# EasyEDA Pro project ProProject_大疆无人机PSDK开发板_2026-03-01.epro, schematic PSDK_STM32
Board Name: Board1; Create Date: 2025-10-24; Page Name: Main; Project Name: 大疆无人机PSDK开发板; Schematic Name: PSDK_STM32; Update Date: 2025-10-24; Company: 嘉立创EDA; Page Size: A2; Version: V1.0
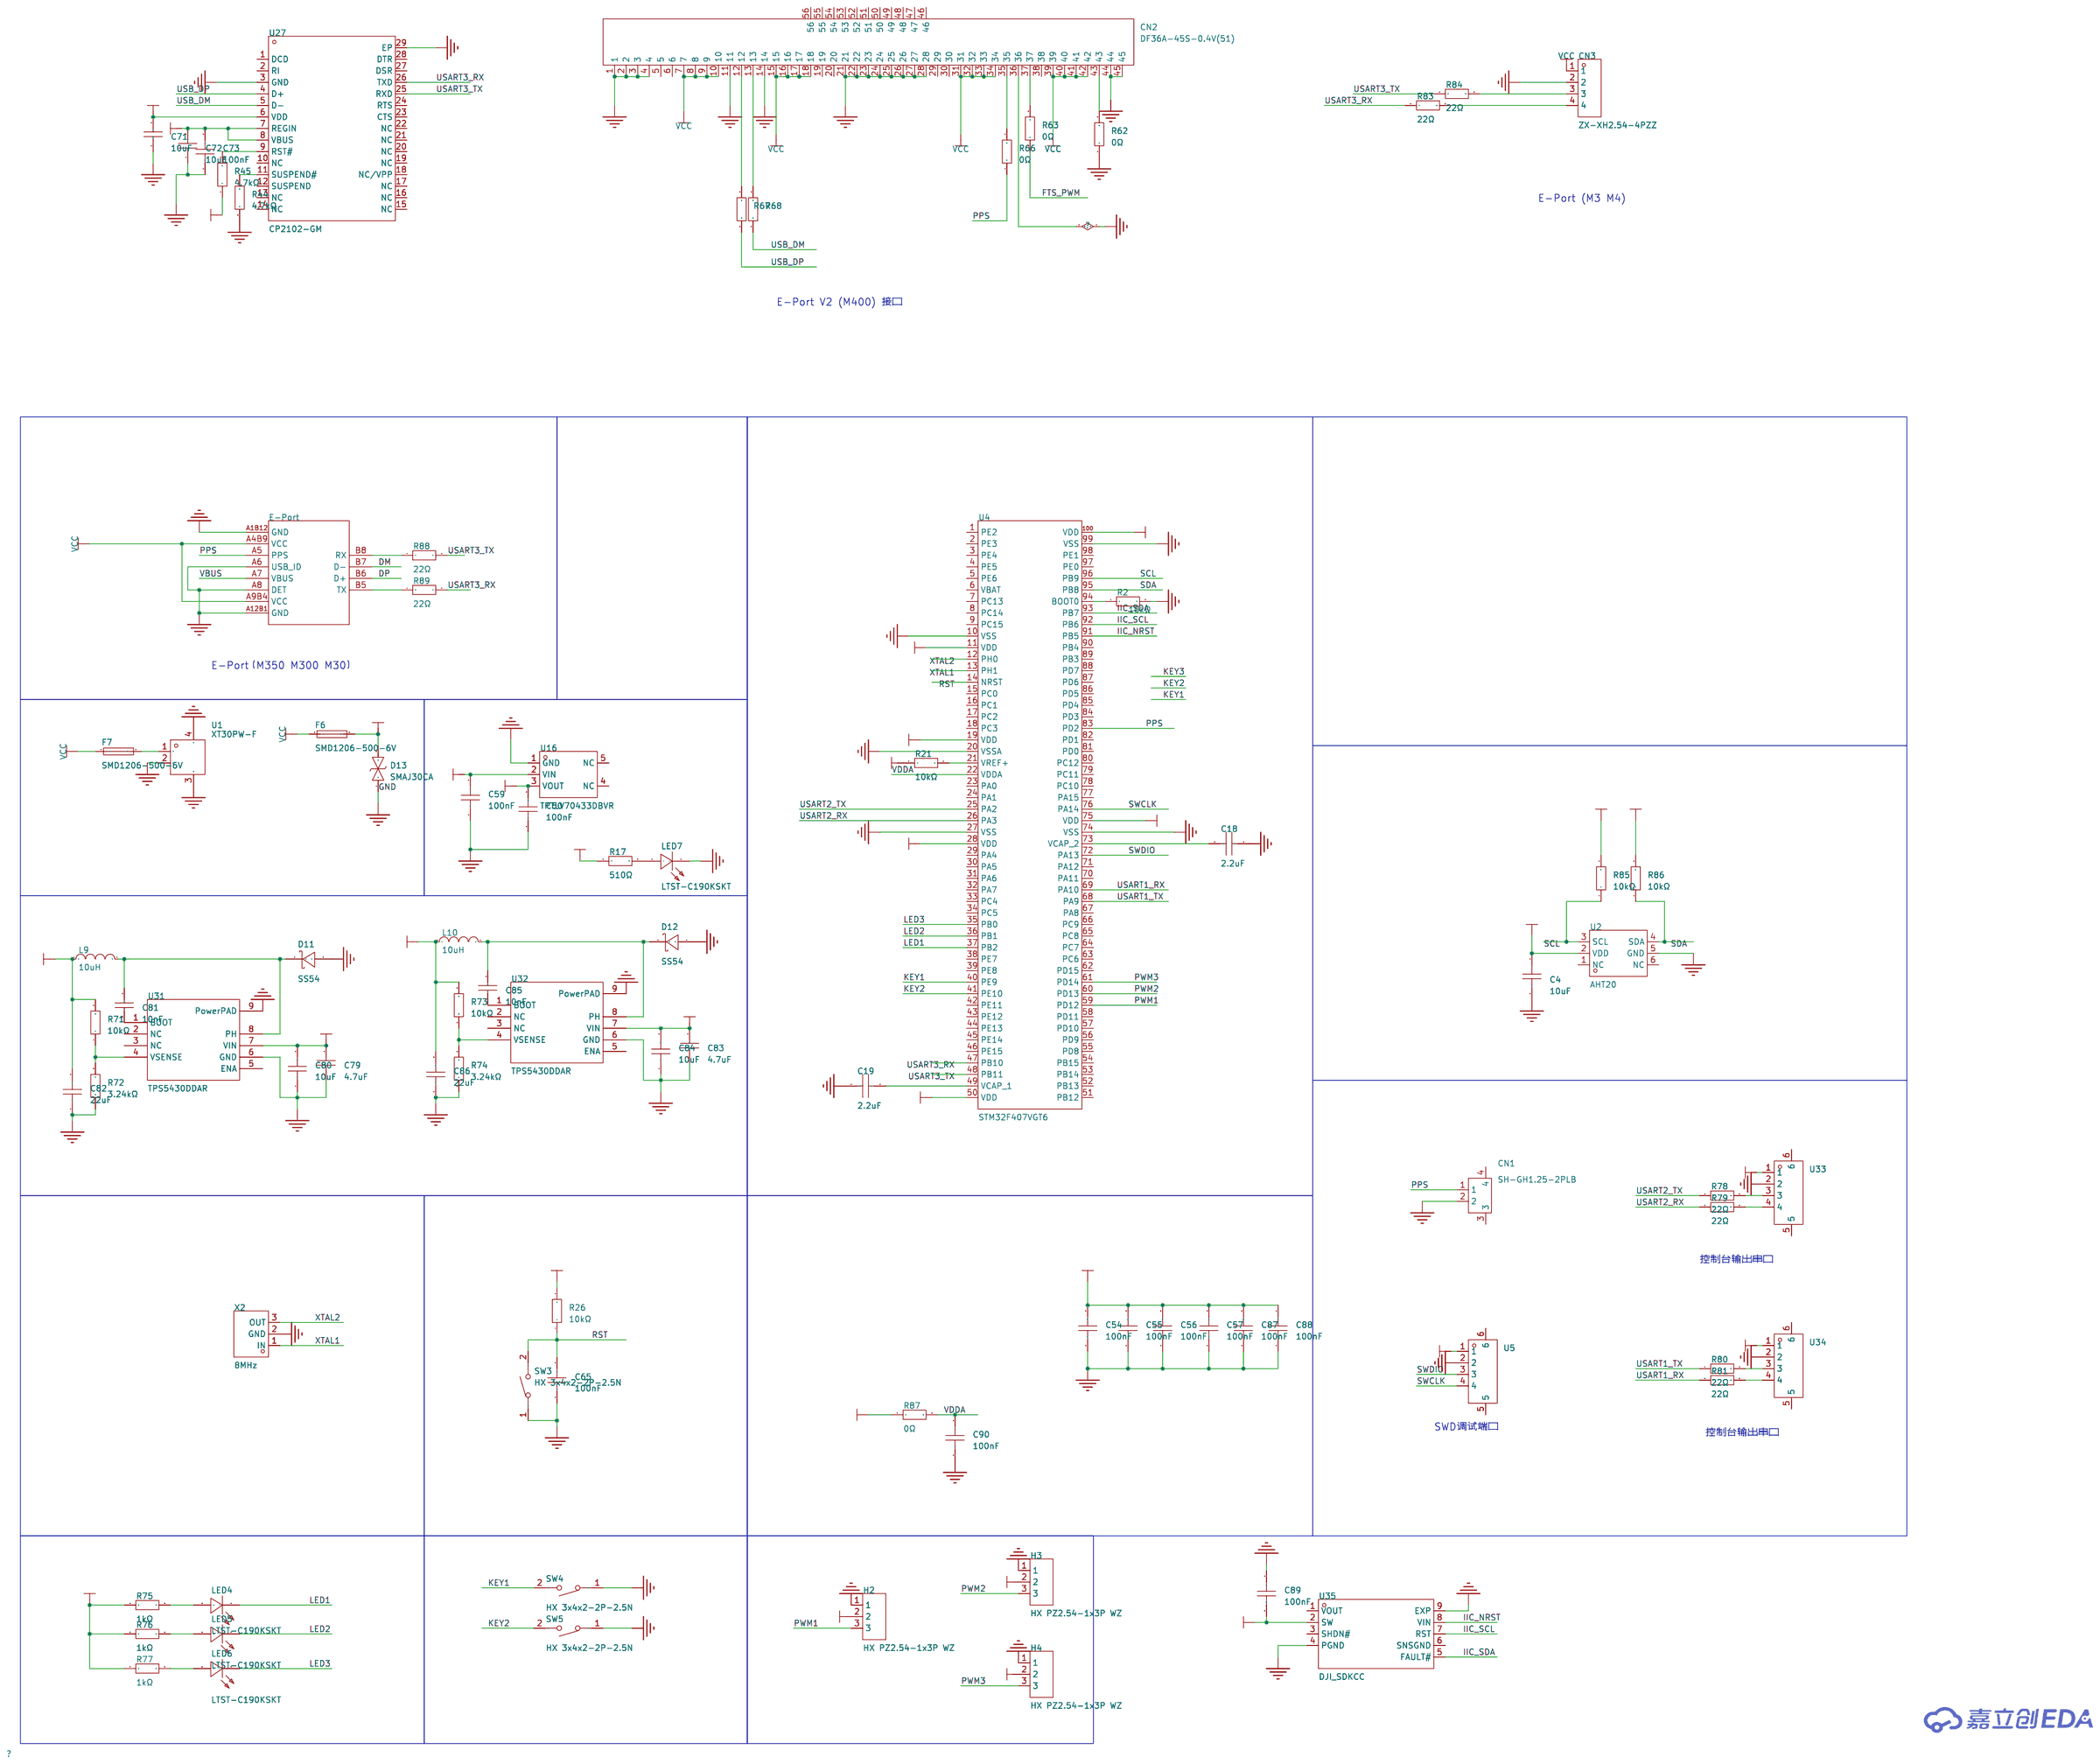
[diagram p0: schematic sheet]

## Parts
C4  10uF  [C0603]
C18  2.2uF  [C0402]
C19  2.2uF  [C0402]
C54  100nF  [C0402]
C55  100nF  [C0402]
C56  100nF  [C0402]
C57  100nF  [C0402]
C59  100nF  [C0603]
C60  100nF  [C0603]
C65  100nF  [C0402]
C71  10uF  [C0402]
C72  10uF  [C0402]
C73  100nF  [C0402]
C79  4.7uF  [C0805]
C80  10uF  [C0805]
C81  10nF  [C0603]
C82  22uF  [C0805]
C83  4.7uF  [C0805]
C84  10uF  [C0805]
C85  10nF  [C0603]
C86  22uF  [C0805]
C87  100nF  [C0402]
C88  100nF  [C0402]
C89  100nF  [C0402]
C90  100nF  [C0402]
CN1  SH-GH1.25-2PLB  [CONN-SMD_2P-P1.25_SHOUHAN_1.25-2PLTDK]
CN2  DF36A-45S-0.4V(51)  [CONN-SMD_45P-P0.40_DF36A-45S-0.4V]
CN3  ZX-XH2.54-4PZZ  [CONN-TH_4P-P2.50_4PIN]
D11  SS54  [SMA_L4.4-W2.8-LS5.4-R-RD]
D12  SS54  [SMA_L4.4-W2.8-LS5.4-R-RD]
D13  SMAJ30CA  [SMA_L4.4-W2.8-LS5.1-BI]
E-Port  -  [PSDK-SMD]
F6  SMD1206-500-6V  [F1206]
F7  SMD1206-500-6V  [F1206]
H2  HX PZ2.54-1x3P WZ  [HDR-TH_3P-P2.54-H-M-W10.4-N]
H3  HX PZ2.54-1x3P WZ  [HDR-TH_3P-P2.54-H-M-W10.4-N]
H4  HX PZ2.54-1x3P WZ  [HDR-TH_3P-P2.54-H-M-W10.4-N]
L9  10uH  [IND-SMD_L5.4-W5.2_FXL0530]
L10  10uH  [IND-SMD_L5.4-W5.2_FXL0530]
LED4  LTST-C190KSKT  [LED0603-RD]
LED5  LTST-C190KSKT  [LED0603-RD]
LED6  LTST-C190KSKT  [LED0603-RD]
LED7  LTST-C190KSKT  [LED0603-RD]
R2  10kΩ  [R0603]
R17  510Ω  [R0603]
R21  10kΩ  [R0402]
R26  10kΩ  [R0402]
R44  4.7kΩ  [R0402]
R45  4.7kΩ  [R0402]
R62  0Ω  [R0402]
R63  0Ω  [R0402]
R66  0Ω  [R0402]
R67  22Ω  [R0402]
R68  22Ω  [R0402]
R71  10kΩ  [R0603]
R72  3.24kΩ  [R0603]
R73  10kΩ  [R0603]
R74  3.24kΩ  [R0603]
R75  1kΩ  [R0603]
R76  1kΩ  [R0603]
R77  1kΩ  [R0603]
R78  22Ω  [R0402]
R79  22Ω  [R0402]
R80  22Ω  [R0402]
R81  22Ω  [R0402]
R83  22Ω  [R0603]
R84  22Ω  [R0603]
R85  10kΩ  [R0402]
R86  10kΩ  [R0402]
R87  0Ω  [R0402]
R88  22Ω  [R0402]
R89  22Ω  [R0402]
SW3  HX 3x4x2-2P-2.5N  [SW-SMD_L4.0-W2.9-LS5.0]
SW4  HX 3x4x2-2P-2.5N  [SW-SMD_L4.0-W2.9-LS5.0]
SW5  HX 3x4x2-2P-2.5N  [SW-SMD_L4.0-W2.9-LS5.0]
U1  XT30PW-F  [CONN-TH_XT30PW-F]
U2  AHT20  [SENSOR-SMD_L3.0-W3.0-P1.00-BR]
U4  STM32F407VGT6  [LQFP-100_L14.0-W14.0-P0.50-LS16.0-BL]
U5  WAFER-GH1.25-4PLB  [CONN-SMD_4P-P1.25_XUNPU_WAFER-GH1.25-4PLB]
U16  TPTLV70433DBVR  [SOT-23-5_L3.0-W1.6-P0.95-LS2.8-BR]
U27  CP2102-GM  [QFN-28_L5.0-W5.0-P0.50-TL-EP3.2]
U31  TPS5430DDAR  [ESOP-8_L4.9-W3.9-P1.27-LS6.0-TL-EP]
U32  TPS5430DDAR  [ESOP-8_L4.9-W3.9-P1.27-LS6.0-TL-EP]
U33  WAFER-GH1.25-4PLB  [CONN-SMD_4P-P1.25_XUNPU_WAFER-GH1.25-4PLB]
U34  WAFER-GH1.25-4PLB  [CONN-SMD_4P-P1.25_XUNPU_WAFER-GH1.25-4PLB]
U35  DJI_SDKCC  [DFN-8_L3.0-W2.0-P0.50-BL-EP]
X2  8MHz  [OSC-SMD_3P-L3.2-W1.3-P1.20]

## Library data of the parts
C4 = CL10A106MA8NRNC: 容值:10uF;精度:±20%;额定电压:25V;材质(温度系数):X5R;; LCSC Part Name: 10uF ±20% 25V; Supplier Part: C96446; Manufacturer: SAMSUNG(三星); Supplier Footprint: 0603; JLCPCB Part Class: 基础库; Datasheet: https://atta.szlcsc.com/upload/public/pdf/source/20170325/1490427913016.pdf; Supplier: LCSC; Tolerance: ±20%; Voltage Rated: 25V; Temperature Coefficient: X5R
C18 C19 = CL05A225MQ5NSNC: 容值:2.2uF;精度:±20%;额定电压:6.3V;温度系数:X5R;; LCSC Part Name: 2.2uF ±20% 6.3V; Supplier Part: C12530; Manufacturer: SAMSUNG(三星); Supplier Footprint: 0402; JLCPCB Part Class: 基础库; Datasheet: https://item.szlcsc.com/datasheet/CL05A225MQ5NSNC/13164.html; Supplier: LCSC; Tolerance: ±20%; Voltage Rating: 6.3V; Temperature Coefficient: X5R
C54-C57 C87 C88 = GRM155R71H104KE14D: 容值:100nF;精度:±10%;额定电压:50V;材质(温度系数):X7R;; LCSC Part Name: 100nF ±10% 50V; Supplier Part: C77020; Manufacturer: muRata(村田); Supplier Footprint: 0402; JLCPCB Part Class: Extended Part; Datasheet: https://atta.szlcsc.com/upload/public/pdf/source/20180326/C77020_39BD49C951FF1AF0DB1F1FAC5AC1E401.pdf; Supplier: LCSC; Tolerance: ±10%; Voltage Rated: 50V; Temperature Coefficient: X7R
C59 C60 = CC0603KRX7R9BB104: 容值:100nF;精度:±10%;额定电压:50V;材质(温度系数):X7R;; LCSC Part Name: 100nF ±10% 50V; Supplier Part: C14663; Manufacturer: YAGEO(国巨); Supplier Footprint: 0603; JLCPCB Part Class: 基础库; Datasheet: https://atta.szlcsc.com/upload/public/pdf/source/20180910/C282072_33301C7F631E79921B82A8DAC6BCC5B3.pdf; Supplier: LCSC; Tolerance: ±10%; Voltage Rated: 50V; Temperature Coefficient: X7R
C65 C73 C89 C90 = CL05B104KB54PNC: 容值:100nF;精度:±10%;额定电压:50V;材质(温度系数):X7R;; LCSC Part Name: 100nF ±10% 50V; Supplier Part: C307331; Manufacturer: SAMSUNG(三星); Supplier Footprint: 0402; JLCPCB Part Class: Basic Part; Datasheet: https://atta.szlcsc.com/upload/public/pdf/source/20160218/1457707763339.pdf; Supplier: LCSC; Tolerance: ±10%; Voltage Rated: 50V; Temperature Coefficient: X7R
C71 C72 = CL05A106MQ5NUNC: 容值:10uF;精度:±20%;额定电压:6.3V;材质(温度系数):X5R;; LCSC Part Name: 10uF ±20% 6.3V; Supplier Part: C15525; Manufacturer: SAMSUNG(三星); Supplier Footprint: 0402; JLCPCB Part Class: Basic Part; Datasheet: https://atta.szlcsc.com/upload/public/pdf/source/20220823/2B02EE04F8F211D38A52DCB16EB6BEBA.pdf; Supplier: LCSC; Tolerance: ±20%; Voltage Rated: 6.3V; Temperature Coefficient: X5R
C79 C83 = CL21A475KAQNNNE: 容值:4.7uF;精度:±10%;额定电压:25V;材质(温度系数):X5R;; LCSC Part Name: 4.7uF ±10% 25V; Supplier Part: C1779; Manufacturer: SAMSUNG(三星); Supplier Footprint: 0805; JLCPCB Part Class: Basic Part; Datasheet: https://atta.szlcsc.com/upload/public/pdf/source/20160218/1457707763339.pdf; Supplier: LCSC; Tolerance: ±10%; Voltage Rated: 25V; Temperature Coefficient: X5R
C80 C84 = CL21A106KAYNNNE_C15850: 容值:10uF;精度:±10%;额定电压:25V;材质(温度系数):X5R;; LCSC Part Name: 10uF ±10% 25V; Supplier Part: C15850; Manufacturer: SAMSUNG(三星); Manufacturer Part: CL21A106KAYNNNE; Supplier Footprint: 0805; JLCPCB Part Class: Basic Part; Datasheet: https://atta.szlcsc.com/upload/public/pdf/source/20160218/1457707763339.pdf; Supplier: LCSC; Tolerance: ±10%; Voltage Rated: 25V; Temperature Coefficient: X5R
C81 C85 = 0603B103K500NT: 容值:10nF;精度:±10%;额定电压:50V;材质(温度系数):X7R;; LCSC Part Name: 10nF ±10% 50V; Supplier Part: C57112; Manufacturer: FH(风华); Supplier Footprint: 0603; JLCPCB Part Class: 基础库; Datasheet: https://atta.szlcsc.com/upload/public/pdf/source/20200305/C486355_26A10D38EF8C2A5C37091D0039909270.pdf; Supplier: LCSC; Tolerance: ±10%; Voltage Rated: 50V; Temperature Coefficient: X7R
C82 C86 = CL21A226MAQNNNE: 容值:22uF;精度:±20%;额定电压:25V;材质(温度系数):X5R;; LCSC Part Name: 22uF ±20% 25V; Supplier Part: C45783; Manufacturer: SAMSUNG(三星); Supplier Footprint: 0805; JLCPCB Part Class: 基础库; Datasheet: https://atta.szlcsc.com/upload/public/pdf/source/20160218/1457707763339.pdf; Supplier: LCSC; Tolerance: ±20%; Voltage Rated: 25V; Temperature Coefficient: X5R
CN1 = SH-GH1.25-2PLB: 插针结构:1x2P;间距:1.25mm;安装方式:立贴;参考系列:GH;总PIN数:2P;排数:1;每排PIN数:2;额定电流:1A;触头材质:磷青铜;触头镀层:锡;工作温度:-25℃~+85℃;; LCSC Part Name: 1x2P 间距:1.25mm 立贴 系列:GH; Supplier Part: C42376899; Manufacturer: SHOU HAN(首韩); Supplier Footprint: SMD,P=1.25mm; Datasheet: https://item.szlcsc.com/datasheet/SH-GH1.25-2PLB/44272939.html; Supplier: LCSC; Pins Structure: 1x2P; Pitch: 1.25mm; Mounting Type: 立贴; Reference Series: GH; Number of Pins: 2P; Number of Rows: 1; Number of PINs Per Row: 2; Current Rating: 1A; Contact Material: 磷青铜; Contact Plating: 锡; Operating Temperature: -25℃~+85℃; Voltage Rating: 125V; Plastic Material: LCP; Flame Retardant Rating: UL94V-0; Color: 米色
CN2 = DF36A-45S-0.4V(51)_C22001977: Supplier Part: C22001977; Manufacturer: HRS(广濑); Supplier Footprint: SMD,P=0.4mm,卧贴; JLCPCB Part Class: 扩展库; Datasheet: https://atta.szlcsc.com/upload/public/pdf/source/20240705/4BAFE627F25BAFC4B98167FD612B90FB.pdf; Supplier: LCSC
CN3 = ZX-XH2.54-4PZZ: 插针结构:1x4P;间距:2.5mm;安装方式:直插;参考系列:XH;总PIN数:4P;排数:1;每排PIN数:4;行距:-;额定电流:3A;触头材质:黄铜;触头镀层:锡;工作温度:-25℃~+85℃;; LCSC Part Name: 1x4P 间距:2.5mm 直插 系列:XH; Supplier Part: C7429634; Manufacturer: Megastar(兆星); Supplier Footprint: 插件,P=2.5mm; JLCPCB Part Class: 扩展库; Datasheet: https://item.szlcsc.com/datasheet/ZX-XH2.54-4PZZ/8427551.html; Supplier: LCSC; Pins Structure: 1x4P; Pitch: 2.5mm; Mounting Type: 直插; Reference Series: XH; Number of Pins: 4P; Number of Rows: 1; Number of PINs Per Row: 4; Current Rating: 3A; Contact Material: 黄铜; Contact Plating: 锡; Operating Temperature: -25℃~+85℃; Voltage Rating: 250V; Plastic Material: PA66; Flame Retardant Rating: UL94V-0; Color: 白色; Z-Height of the Board: 7mm; X-Length of Bottom Edge on Board (Spacing Line): 12.5mm; Y-Width of Bottom Edge on Board: 5.9mm
D11 D12 = SS54_C22452: 直流反向耐压（Vr）:40V;平均整流电流（Io）:5A;正向压降（Vf）:550mV @ 5A;; Supplier Part: C22452; Manufacturer: MDD; Supplier Footprint: SMA(DO-214AC); JLCPCB Part Class: 基础库; Datasheet: https://atta.szlcsc.com/upload/public/pdf/source/20230314/529CD85F9B31F69841D3A079BC07E377.pdf; Supplier: LCSC; Forward Voltage (Vf@If): 550mV@5A; Reverse Voltage (Vr): 40V; Average Rectified Current (Io): 5A; Reverse Leakage Current (Ir): 1mA@40V
D13 = SMAJ30CA_C908828: 反向截止电压(Vrwm):30V;最大钳位电压:48.4V;峰值脉冲电流(Ipp)@10/1000us:8.3A;击穿电压:33.3V;; LCSC Part Name: 双向TVS 30V截止 8.3A峰值脉冲; Supplier Part: C908828; Manufacturer: GOODWORK(固得沃克); Supplier Footprint: SMA(DO-214AC); JLCPCB Part Class: Extended Part; Datasheet: https://atta.szlcsc.com/upload/public/pdf/source/20201231/C908757_5436EAF671B686EFC2F0DD2098F0ED89.pdf; Supplier: LCSC; Reverse Stand-Off Voltage (Vrwm): 30V; Maximum Clamping Voltage: 48.4V; Peak Pulse Current (Ipp)@10/1000us: 8.3A; Breakdown Voltage: 33.3V; Reverse Leakage Current (Ir): 5uA; Type: TVS
E-Port = E-Port: E-Port接口
F6 F7 = SMD1206-500-6V: 最大电压:6V;最大电流:50A;保持电流:5A;跳闸电流:10A;; LCSC Part Name: 6V 5A 1206自恢复; Supplier Part: C2760308; Manufacturer: BNstar(比诺星); Supplier Footprint: 1206; JLCPCB Part Class: Extended Part; Datasheet: https://atta.szlcsc.com/upload/public/pdf/source/20210406/C2760308_0B2BB5269508B162565B8482311CFD3E.pdf; Supplier: LCSC; Operating Voltage (Max): 6V; Current Rating (Max): 50A; Hold Current: 5A; Trip Current: 10A; Power Dissipation: 1.5W; Resistance - Initial (Ri) (Min): 1mΩ; Resistance - Post Trip (R1) (Max): 12mΩ; Maximum Time to Trip: 5s; Operating Temperature: -40℃~+70℃
H2-H4 = HX PZ2.54-1x3P WZ: 插针结构:1x3P;间距:2.54mm;行距:-;圆针/方针:方针;安装方式:弯插;排数:单排;总PIN位数:3P;额定电流:3A;额定电压:1kV;配合针长度:6mm;塑高:2.5mm;端接针长度:-;触头材质:黄铜;触头镀层:金;工作温度:-40℃~+105℃;颜色:黑色;; LCSC Part Name: 1x3P 间距:2.54mm 方针 弯插; Supplier Part: C32713262; Manufacturer: hanxia(韩下); Supplier Footprint: 弯插,P=2.54mm; JLCPCB Part Class: 扩展库; Datasheet: https://item.szlcsc.com/datasheet/HX%2520PZ2.54-1x3P%2520WZ/34444542.html; Supplier: LCSC; Pin Structure: 1x3P; Pitch: 2.54mm; Circluar Pins/Square Pins: 方针; Mounting Type: 弯插; Number of Rows: 单排; Number of Pins: 3P; Current Rating: 3A; Voltage Rating (Max): 1kV; Length of Mating Pin: 6mm; Insulation Height: 2.5mm; Contact Material: 黄铜; Contact Plating: 金; Operating Temperature: -40℃~+105℃; Color: 黑色
L9 L10 = FXL0530-100-M: 电感值:10uH;精度:±20%;额定电流:3.2A;饱和电流(Isat):3.5A;类型:一体成型电感;; LCSC Part Name: 10uH ±20% 3.5A; Supplier Part: C177248; Manufacturer: cjiang(长江微电); Supplier Footprint: SMD,5.2x5.4mm; JLCPCB Part Class: 扩展库; Datasheet: https://atta.szlcsc.com/upload/public/pdf/source/20240426/3189EA8206330E2108542F9E34E540E7.pdf; Supplier: LCSC; Tolerance: ±20%; Rated Current: 3.2A; Saturation Current (Isat): 3.5A; DC Resistance (DCR): 125mΩ; Type: 一体成型电感
LED4-LED7 = LTST-C190KSKT: 发光颜色:黄色;正向电压(VF):2.1V;功率:75mW;正向电流:20mA;主波长:584.5nm~597nm;二极管配置:-;透镜颜色:无色透明透镜;色温:-;发光强度:104mcd;发光角度:130°;载带方式:-;工作温度:-30℃~+85℃;; LCSC Part Name: 黄灯; Supplier Part: C125095; Manufacturer: LITEON(光宝); Supplier Footprint: 0603; JLCPCB Part Class: 扩展库; Datasheet: https://atta.szlcsc.com/upload/public/pdf/source/20180129/C125095_15171881843821315881.pdf; Supplier: LCSC; Emitted Color: 黄色; Forward Voltage (VF): 2.1V; Power Dissipation: 75mW; Forward Current: 20mA; Dominant Wavelength: 584.5nm~597nm; Peak Wavelength: 588nm; Lens Color: 无色透明透镜; Luminous Intensity: 104mcd; Viewing Angle: 130°; Operating Temperature: -30℃~+85℃
R2 R71 R73 = 0603WAF1002T5E: 电阻类型:厚膜电阻;阻值:10kΩ;精度:±1%;功率:100mW;; LCSC Part Name: 厚膜电阻 10kΩ ±1% 100mW; Supplier Part: C25804; Manufacturer: UNI-ROYAL(厚声); Supplier Footprint: 0603; JLCPCB Part Class: 基础库; Datasheet: https://atta.szlcsc.com/upload/public/pdf/source/20200306/C422600_1E6D84923E4A46A82E41ADD87F860B5C.pdf; Supplier: LCSC; Type: 厚膜电阻; Tolerance: ±1%; Power(Watts): 100mW; Temperature Coefficient: ±100ppm/℃; Overload Voltage (Max): 75V; Operating Temperature Range: -55℃~+155℃
R17 = 0603WAF5100T5E: 电阻类型:厚膜电阻;阻值:510Ω;精度:±1%;功率:100mW;; LCSC Part Name: 510Ω ±1% 100mW; Supplier Part: C23193; Manufacturer: UNI-ROYAL(厚声); Supplier Footprint: 0603; JLCPCB Part Class: 基础库; Datasheet: https://atta.szlcsc.com/upload/public/pdf/source/20200306/C422600_1E6D84923E4A46A82E41ADD87F860B5C.pdf; Supplier: LCSC; Type: 厚膜电阻; Tolerance: ±1%; Power(Watts): 100mW; Temperature Coefficient: ±100ppm/℃; Overload Voltage (Max): 75V; Operating Temperature Range: -55℃~+155℃
R21 R85 R86 = 0402WGF1002TCE: 电阻类型:厚膜电阻;阻值:10kΩ;精度:±1%;功率:62.5mW;工作电压:50V;温度系数:±100ppm/℃;; LCSC Part Name: 10kΩ ±1% 62.5mW 厚膜电阻; Supplier Part: C25744; Manufacturer: UNI-ROYAL(厚声); Supplier Footprint: 0402; JLCPCB Part Class: 基础库; Datasheet: https://item.szlcsc.com/datasheet/0402WGF1002TCE/26487.html; Supplier: LCSC; Type: 厚膜电阻; Tolerance: ±1%; Power(Watts): 62.5mW; Voltage-Supply(Max): 50V; Temperature Coefficient: ±100ppm/℃; Operating Temperature: -55℃~+155℃
R26 = 0402WGF1002TCE: 电阻类型:厚膜电阻;阻值:10kΩ;精度:±1%;功率:62.5mW;工作电压:50V;温度系数:±100ppm/℃;; LCSC Part Name: 10kΩ ±1% 62.5mW 厚膜电阻; Supplier Part: C25744; Manufacturer: UNI-ROYAL(厚声); Supplier Footprint: 0402; JLCPCB Part Class: 基础库; Datasheet: https://item.szlcsc.com/datasheet/0402WGF1002TCE/26487.html; Supplier: LCSC; Type: 厚膜电阻; Tolerance: ±1%; Power(Watts): 62.5mW; Voltage-Supply(Max): 50V; Temperature Coefficient: ±100ppm/℃; Operating Temperature: -55℃~+155℃; Overload Voltage (Max): 50V; Operating Temperature Range: -55℃~+155℃
R44 R45 = 0402WGF4701TCE: 电阻类型:厚膜电阻;阻值:4.7kΩ;精度:±1%;功率:62.5mW;最大工作电压:50V;温度系数:±100ppm/℃;; LCSC Part Name: 4.7kΩ ±1% 62.5mW 厚膜电阻; Supplier Part: C25900; Manufacturer: UNI-ROYAL(厚声); Supplier Footprint: 0402; JLCPCB Part Class: Basic Part; Datasheet: https://atta.szlcsc.com/upload/public/pdf/source/20200306/C422600_1E6D84923E4A46A82E41ADD87F860B5C.pdf; Supplier: LCSC; Type: 厚膜电阻; Tolerance: ±1%; Power(Watts): 62.5mW; Overload Voltage (Max): 50V; Temperature Coefficient: ±100ppm/℃; Operating Temperature Range: -55℃~+155℃
R62 R63 R66 R87 = 0402WGF0000TCE: 电阻类型:厚膜电阻;阻值:0Ω;精度:±1%;功率:62.5mW;最大工作电压:50V;温度系数:±800ppm/℃;; LCSC Part Name: 0Ω ±1% 62.5mW 厚膜电阻; Supplier Part: C17168; Manufacturer: UNI-ROYAL(厚声); Supplier Footprint: 0402; JLCPCB Part Class: Basic Part; Datasheet: https://atta.szlcsc.com/upload/public/pdf/source/20200306/C422600_1E6D84923E4A46A82E41ADD87F860B5C.pdf; Supplier: LCSC; Type: 厚膜电阻; Tolerance: ±1%; Power(Watts): 62.5mW; Overload Voltage (Max): 50V; Temperature Coefficient: ±800ppm/℃; Operating Temperature Range: -55℃~+155℃
R67 R68 R78-R81 R88 R89 = 0402WGF220JTCE: 电阻类型:厚膜电阻;阻值:22Ω;精度:±1%;功率:62.5mW;最大工作电压:50V;温度系数:±100ppm/℃;; LCSC Part Name: 22Ω ±1% 62.5mW 厚膜电阻; Supplier Part: C25092; Manufacturer: UNI-ROYAL(厚声); Supplier Footprint: 0402; JLCPCB Part Class: 基础库; Datasheet: https://atta.szlcsc.com/upload/public/pdf/source/20200306/C422600_1E6D84923E4A46A82E41ADD87F860B5C.pdf; Supplier: LCSC; Type: 厚膜电阻; Tolerance: ±1%; Power(Watts): 62.5mW; Overload Voltage (Max): 50V; Temperature Coefficient: ±100ppm/℃; Operating Temperature Range: -55℃~+155℃
R72 R74 = 0603WAF3241T5E: 电阻类型:厚膜电阻;阻值:3.24kΩ;精度:±1%;功率:100mW;最大工作电压:75V;温度系数:±100ppm/℃;; LCSC Part Name: 3.24kΩ ±1% 100mW 厚膜电阻; Supplier Part: C22994; Manufacturer: UNI-ROYAL(厚声); Supplier Footprint: 0603; JLCPCB Part Class: Extended Part; Datasheet: https://atta.szlcsc.com/upload/public/pdf/source/20200306/C422600_1E6D84923E4A46A82E41ADD87F860B5C.pdf; Supplier: LCSC; Type: 厚膜电阻; Tolerance: ±1%; Power(Watts): 100mW; Overload Voltage (Max): 75V; Temperature Coefficient: ±100ppm/℃; Operating Temperature Range: -55℃~+155℃
R75-R77 = 0603WAF1001T5E: 电阻类型:厚膜电阻;阻值:1kΩ;精度:±1%;功率:100mW;; LCSC Part Name: 1kΩ ±1% 100mW; Supplier Part: C21190; Manufacturer: UNI-ROYAL(厚声); Supplier Footprint: 0603; JLCPCB Part Class: 基础库; Datasheet: https://atta.szlcsc.com/upload/public/pdf/source/20200306/C422600_1E6D84923E4A46A82E41ADD87F860B5C.pdf; Supplier: LCSC; Type: 厚膜电阻; Tolerance: ±1%; Power(Watts): 100mW; Temperature Coefficient: ±100ppm/℃; Overload Voltage (Max): 75V; Operating Temperature Range: -55℃~+155℃
R83 R84 = 0603WAF220JT5E: 电阻类型:厚膜电阻;阻值:22Ω;精度:±1%;功率:100mW;; LCSC Part Name: 22Ω ±1% 100mW; Supplier Part: C23345; Manufacturer: UNI-ROYAL(厚声); Supplier Footprint: 0603; JLCPCB Part Class: 基础库; Datasheet: https://atta.szlcsc.com/upload/public/pdf/source/20200306/C422600_1E6D84923E4A46A82E41ADD87F860B5C.pdf; Supplier: LCSC; Type: 厚膜电阻; Tolerance: ±1%; Power(Watts): 100mW; Temperature Coefficient: ±100ppm/℃; Overload Voltage (Max): 75V; Operating Temperature Range: -55℃~+155℃
SW3-SW5 = HX 3x4x2-2P-2.5N: 电路结构:单刀单掷;按钮形状:圆形按钮;作用力:2.5N;安装方式:立贴;开关长度:4mm;开关宽度:3mm;开关高度:2mm;带支架:不带支架;触点电流:50mA;额定电压:12V;带灯:无;工作寿命:10万次;; LCSC Part Name: 4*3*2mm 立贴 轻触开关; Supplier Part: C36498961; Manufacturer: hanxia(韩下); Supplier Footprint: SMD,3x4mm; JLCPCB Part Class: 扩展库; Datasheet: https://item.szlcsc.com/datasheet/HX%25203x4x2-2P-2.5N/38220903.html; Supplier: LCSC; Circuit: 单刀单掷; Actuator Style: 圆形按钮; Operating Force: 2.5N; Mounting Type: 立贴; Length: 4mm; Width: 3mm; Switch Height: 2mm; with Bracket: 不带支架; Contact Current: 50mA; Voltage Rating: 12V; Actuator/Cap Color: 黑色; With Lamp: 无; Termination Style: SMD接片; Life: 10万次
U1 = XT30PW-F: Supplier Part: C2913282; Supplier Footprint: HDR-1X2; JLCPCB Part Class: 扩展库; Supplier: LCSC
U2 = AHT20: Supplier Part: C2757850; Manufacturer: 广州奥松; Supplier Footprint: SMD; JLCPCB Part Class: 扩展库; Datasheet: https://atta.szlcsc.com/upload/public/pdf/source/20200407/C503357_487829B2F97386053400E2E73B0ABB4D.pdf; Supplier: LCSC
U4 = STM32F407VGT6: CPU内核:ARM-M4;CPU最大主频:168MHz;应用领域:-;; LCSC Part Name: 带DSP和FPU的高性能基础系列ARM Cortex-M4 MCU，具有1 MB Flash、168 MHz CPU、ART加速器、以太网和FSMC; Supplier Part: C12345; Manufacturer: ST(意法半导体); Supplier Footprint: LQFP-100(14x14); JLCPCB Part Class: 扩展库; Datasheet: https://item.szlcsc.com/datasheet/STM32F407VGT6/12968.html; Supplier: LCSC; CPU Core: ARM-M4; CPU Maximum Speed: 168MHz; Program Storage Size: 1MB; Program Memory Type: FLASH; Number of I/O: 82; ADC (Bit): 12bit; DAC (Bit): 12bit; Voltage - Supply: 1.8V~3.6V
U5 U33 U34 = WAFER-GH1.25-4PLB: 插针结构:1x4P;间距:1.25mm;安装方式:立贴;参考系列:GH;总PIN数:4P;排数:1;每排PIN数:4;行距:-;额定电流:1A;触头材质:黄铜;触头镀层:锡;工作温度:-25℃~+85℃;; LCSC Part Name: 1x4P 间距:1.25mm 立贴 系列:GH; Supplier Part: C3029370; Manufacturer: XUNPU(讯普); Supplier Footprint: SMD,P=1.25mm; JLCPCB Part Class: 扩展库; Datasheet: https://item.szlcsc.com/datasheet/WAFER-GH1.25-4PLB/3561382.html; Supplier: LCSC; Pins Structure: 1x4P; Pitch: 1.25mm; Mounting Type: 立贴; Reference Series: GH; Number of Pins: 4P; Number of Rows: 1; Number of PINs Per Row: 4; Current Rating: 1A; Contact Material: 黄铜; Contact Plating: 锡; Operating Temperature: -25℃~+85℃; Voltage Rating: 125V; Plastic Material: LCP; Supplementary Features: 辅助焊脚; Color: 米色; Z-Height of the Board: 4.2mm; X-Length of Bottom Edge on Board (Spacing Line): 8.25mm; Y-Width of Bottom Edge on Board: 4.95mm
U16 = TPTLV70433DBVR: LCSC Part Name: 150mA, High Voltage Regulator; Supplier Part: C3011203; Manufacturer: TECH PUBLIC(台舟); Supplier Footprint: SOT-23-5; JLCPCB Part Class: 扩展库; Datasheet: https://atta.szlcsc.com/upload/public/pdf/source/20220510/E4135E517B2B10B98A91071AE5AA249A.pdf; Supplier: LCSC
U27 = CP2102-GM: 应用功能:USB转UART;接口协议:UART;; LCSC Part Name: Silicon Labs-MCU; Supplier Part: C430012; Manufacturer: SKYWORKS/SILICON LABS(芯科); Supplier Footprint: QFN-28-EP(5x5); JLCPCB Part Class: 扩展库; Datasheet: https://atta.szlcsc.com/upload/public/pdf/source/20190920/C430014_98A01585C07E39A29412843282533F6F.pdf; Supplier: LCSC; Applications Function: USB转UART; Protocol: UART; Supply Voltage: 3V~3.6V; Operating Temperature: -40℃~+85℃
U31 U32 = TPS5430DDAR: 功能类型:降压型;同步整流:-;输出通道数:-;拓扑结构:-;输入电压:-;输出电流(最大值):-;开关频率:-;; LCSC Part Name: 降压型; Supplier Part: C9864; Manufacturer: TI(德州仪器); Supplier Footprint: SO-8; JLCPCB Part Class: 基础库; Datasheet: https://atta.szlcsc.com/upload/public/pdf/source/20161207/1481104217724.pdf; Supplier: LCSC; Function: 降压型; Output Type: 可调; Output Voltage: 1.221V~32.04V; Operating Temperature: -40℃~+125℃@(TJ); Switch tube (built-in/external): 内置
U35 = LTC3529EDCB#TRMPBF: 功能类型:升压型;工作电压:1.6V~5.5V;输出电压:5V;输出电流:1.5A;; LCSC Part Name: 采用 2mm x 3mm DFN 封装的 1.5A、1.5MHz 升压型 DC/DC 转换器; Supplier Part: C82574; Manufacturer: ADI(亚德诺); Supplier Footprint: DFN-8-EP(2x3); JLCPCB Part Class: Extended Part; Datasheet: https://atta.szlcsc.com/upload/public/pdf/source/20180224/C82574_15194370374361364070.pdf; Supplier: LCSC; Function: 升压型; Input Voltage: 1.6V~5.5V; Output Voltage: 5V; Output Current: 1.5A; Switching Frequency: 1.5MHz; Operating Temperature: -40℃~+85℃; Synchronous Rectification: 是; Number of Outputs: 1; Topology: 升压式; Switch tube (built-in/external): 内置
X2 = CSTNE8M00G520000R0: 频率:8MHz;内置负载电容:10pF;谐振阻抗:40Ω;; LCSC Part Name: 8MHz ±0.5% 内置负载电容:10pF; Supplier Part: C907975; Manufacturer: muRata(村田); Supplier Footprint: SMD3213-3P; JLCPCB Part Class: Extended Part; Datasheet: https://atta.szlcsc.com/upload/public/pdf/source/20201022/C907975_BE77A173E35C03920A12013DDB2B8858.pdf; Supplier: LCSC; Built-in Load Capacitance: 10pF; Resonant Impedance: 40Ω; Operating Temperature: -40℃~+85℃

## Nets
3.3V: C4.1 C54.2 C55.2 C56.2 C57.2 C60.2 C71.2 C87.2 C88.2 C89.2 R17.1 R21.1 R26.2 R45.1 R75.1 R76.1 R77.1 R85.2 R86.2 R87.1 U2.2(VDD) U4.11(VDD) U4.19(VDD) U4.28(VDD) U4.50(VDD) U4.75(VDD) U4.100(VDD) U5.1 U16.3(VOUT) U27.6(VDD) U33.1 U35.2(SW)
5V: C59.2 C72.2 C73.2 C82.2 C86.2 H2.2 H3.2 H4.2 L9.1 L10.1 R71.2 R73.2 U16.2(VIN) U27.7(REGIN) U27.8(VBUS) U34.1
GND: C4.2 C18.2 C19.1 C54.1 C55.1 C56.1 C57.1 C59.1 C60.1 C65.1 C71.1 C72.1 C73.1 C79.1 C80.1 C82.1 C83.1 C84.1 C86.1 C87.1 C88.1 C89.1 C90.1 CN1.2 CN2.1 CN2.2 CN2.3 CN2.4 CN2.11 CN2.14 CN2.21 CN2.22 CN2.23 CN2.24 CN2.25 CN2.26 CN2.27 CN2.28 CN2.36 CN2.44 CN2.45 CN3.2 D11.1(A) D12.1(A) D13.1 E-Port.A1B12(GND) E-Port.A6(USB_ID) E-Port.A8(DET) E-Port.A12B1(GND) H2.1 H3.1 H4.1 LED7.1(-) R2.2 R44.1 R62.1 R72.1 R74.1 SW3.1 SW4.1 SW5.1 U1.2 U1.3 U1.4 U2.5(GND) U4.10(VSS) U4.20(VSSA) U4.27(VSS) U4.74(VSS) U4.99(VSS) U5.2 U16.1(GND) U27.3(GND) U27.29(EP) U31.6(GND) U31.9(PowerPAD) U32.6(GND) U32.9(PowerPAD) U33.2 U34.2 U35.4(PGND) U35.9(EXP) X2.2(GND)
VBUS: E-Port.A7(VBUS)
VCC: CN2.7 CN2.8 CN2.9 CN2.10 CN2.15 CN2.16 CN2.17 CN2.18 CN2.31 CN2.32 CN2.33 CN2.34 CN2.39 CN2.40 CN2.41 CN2.42 CN3.1 E-Port.A4B9(VCC) E-Port.A9B4(VCC) F6.1 F7.1
VDDA: C90.2 R87.2 U4.22(VDDA)
VIN: C79.2 C80.2 C83.2 C84.2 D13.2 F6.2 U31.7(VIN) U32.7(VIN)
DM: E-Port.B7(D-)
DP: E-Port.B6(D+)
FTS_PWM: R63.1
IIC_NRST: U4.91(PB5) U35.8(VIN)
IIC_SCL: U4.92(PB6) U35.7(RST)
IIC_SDA: U4.93(PB7) U35.5(FAULT#)
KEY1: SW4.2 U4.40(PE9)
KEY2: SW5.2 U4.41(PE10)
LED1: LED4.1(-) U4.37(PB2)
LED2: LED5.1(-) U4.36(PB1)
LED3: LED6.1(-) U4.35(PB0)
PPS: CN1.1 E-Port.A5(PPS) R66.1 U4.83(PD2)
PWM1: H2.3 U4.59(PD12)
PWM2: H3.3 U4.60(PD13)
PWM3: H4.3 U4.61(PD14)
RST: C65.2 R26.1 SW3.2 U4.14(NRST)
SCL: R85.1 U2.3(SCL) U4.96(PB9)
SDA: R86.1 U2.4(SDA) U4.95(PB8)
SWCLK: U4.76(PA14) U5.4
SWDIO: U4.72(PA13) U5.3
USART1_RX: R81.1 U4.69(PA10)
USART1_TX: R80.1 U4.68(PA9)
USART2_RX: R79.1 U4.26(PA3)
USART2_TX: R78.1 U4.25(PA2)
USART3_RX: R83.1 R89.2 U4.47(PB10) U27.26(TXD)
USART3_TX: R84.1 R88.2 U4.48(PB11) U27.25(RXD)
USB_DM: R68.1 U27.5(D-)
USB_DP: R67.1 U27.4(D+)
XTAL1: U4.13(PH1) X2.1(IN)
XTAL2: U4.12(PH0) X2.3(OUT)
$1N1193: E-Port.B8(RX) R88.1
$1N1196: E-Port.B5(TX) R89.1
$1N5067: R2.1 U4.94(BOOT0)
$1N50893: C18.1 U4.73(VCAP_2)
$1N50929: C19.2 U4.49(VCAP_1)
$1N51439: R21.2 U4.21(VREF+)
$1N51857: C81.1 U31.1(BOOT)
$1N51860: R71.1 R72.2 U31.4(VSENSE)
$1N51861: C81.2 D11.2(K) L9.2 U31.8(PH)
$1N52286: C85.1 U32.1(BOOT)
$1N52289: R73.1 R74.2 U32.4(VSENSE)
$1N52290: C85.2 D12.2(K) L10.2 U32.8(PH)
$1N52830: LED4.2(+) R75.2
$1N52831: LED5.2(+) R76.2
$1N52832: LED6.2(+) R77.2
$1N53330: R78.2 U33.3
$1N53334: R79.2 U33.4
$1N53516: R80.2 U34.3
$1N53518: R81.2 U34.4
$1N55427: R45.2 U27.9(RST#)
$1N55429: R44.2 U27.11(SUSPEND#)
$1N56036: CN2.43 R62.2
$1N56037: CN2.37 R63.2
$1N56045: CN2.35 R66.2
$1N56047: CN2.12 R67.2
$1N56048: CN2.13 R68.2
$1N56278: CN3.3 R84.2
$1N56282: CN3.4 R83.2
$1N56811: LED7.2(+) R17.2
$1N56916: F7.2 U1.1

Not connected (* = marked no-connect by the designer): CN1 3 4; CN2 5 6 19 20 29 30 38 46 47 48 49 50 51 52 53 54 55 56; U2 1(NC) 6(NC); U4 1(PE2) 2(PE3) 3(PE4) 4(PE5) 5(PE6) 6(VBAT) 7(PC13) 8(PC14) 9(PC15) 15(PC0) 16(PC1) 17(PC2) 18(PC3) 23(PA0) 24(PA1) 29(PA4) 30(PA5) 31(PA6) 32(PA7) 33(PC4) 34(PC5) 38(PE7) 39(PE8) 42(PE11) 43(PE12) 44(PE13) 45(PE14) 46(PE15) 51(PB12) 52(PB13) 53(PB14) 54(PB15) 55(PD8) 56(PD9) 57(PD10) 58(PD11) 62(PD15) 63(PC6) 64(PC7) 65(PC8) 66(PC9) 67(PA8) 70(PA11) 71(PA12) 77(PA15) 78(PC10) 79(PC11) 80(PC12) 81(PD0) 82(PD1) 84(PD3) 85(PD4) 86(PD5) 87(PD6) 88(PD7) 89(PB3) 90(PB4) 97(PE0) 98(PE1); U5 5 6; U16 4(NC) 5(NC); U27 1(DCD) 2(RI) 10(NC) 12(SUSPEND) 13(NC) 14(NC) 15(NC) 16(NC) 17(NC) 18(NC/VPP) 19(NC) 20(NC) 21(NC) 22(NC) 23(CTS) 24(RTS) 27(DSR) 28(DTR); U31 2(NC) 3(NC) 5(ENA); U32 2(NC) 3(NC) 5(ENA); U33 5 6; U34 5 6; U35 1(VOUT) 3(SHDN#) 6(SNSGND)

## Notes on the sheet
- E-Port (M3 M4)
- E-Port V2 (M400) 接口
- E-Port（M350 M300 M30）
- 控制台输出串口
- SWD调试端口
- 控制台输出串口
